# Altium schematic sheet PANEL_CH.SchDoc
size A4; SheetNumber: 9; SheetTotal: 9
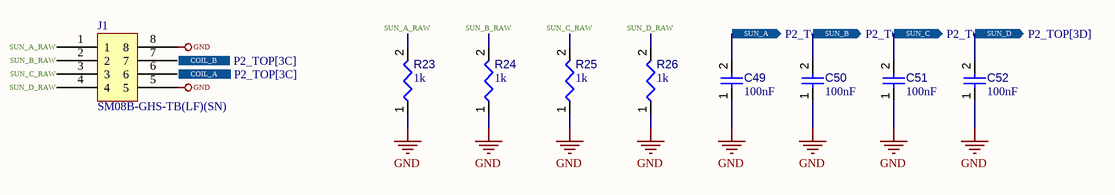
[diagram p0: PANEL_CH.SchDoc]

## Parts
C49  value 100nF  [CAPC0402(1005)60_L]  (hidden comment: Capacitor 100nF +/-20% 25V 0402)
C50  value 100nF  [CAPC0402(1005)60_L]  (hidden comment: Capacitor 100nF +/-20% 25V 0402)
C51  value 100nF  [CAPC0402(1005)60_L]  (hidden comment: Capacitor 100nF +/-20% 25V 0402)
C52  value 100nF  [CAPC0402(1005)60_L]  (hidden comment: Capacitor 100nF +/-20% 25V 0402)
J1  SM08B-GHS-TB(LF)(SN)
R23  value 1k  [RESC0402(1005)_L]  (hidden comment: Resistor 1K +/-5 % 0402 63 mW)
R24  value 1k  [RESC0402(1005)_L]  (hidden comment: Resistor 1K +/-5 % 0402 63 mW)
R25  value 1k  [RESC0402(1005)_L]  (hidden comment: Resistor 1K +/-5 % 0402 63 mW)
R26  value 1k  [RESC0402(1005)_L]  (hidden comment: Resistor 1K +/-5 % 0402 63 mW)

## Ports
COIL_A (out, see P2_TOP[3C]), COIL_B (out, see P2_TOP[3C]), SUN_A (out, see P2_TOP[3C]), SUN_B (out, see P2_TOP[3D]), SUN_C (out, see P2_TOP[3D]), SUN_D (out, see P2_TOP[3D])

## Nets
GND: C49.1 C50.1 C51.1 C52.1 J1.5 J1.8 R23.1 R24.1 R25.1 R26.1
COIL_A: J1.6 ; port COIL_A
COIL_B: J1.7 ; port COIL_B
SUN_A: C49.2 ; port SUN_A
SUN_A_RAW: J1.1 R23.2
SUN_B: C50.2 ; port SUN_B
SUN_B_RAW: J1.2 R24.2
SUN_C: C51.2 ; port SUN_C
SUN_C_RAW: J1.3 R25.2
SUN_D: C52.2 ; port SUN_D
SUN_D_RAW: J1.4 R26.2

## Library data of the parts
C49-C52 = CMP-001-00065-4: Chip Capacitor, 100nF +/-20%, 25V, 0402, Thickness 0.6 mm; Tolerance: 10%; Max Operating Temperature: 85°C; Min Operating Temperature: -55°C; Pins: 2; Voltage Rating: 25V; Mounting Technology: SMT; Case/Package: 0402
J1 = CMP-002-00081-2: Connector Header Surface Mount, Right Angle 8 position 0.049" (1.25mm); Voltage Rating: 50V; Contact Resistance: 50mΩ; Gender: Male; Number of Contacts: 8; Current Rating: 1A; Pitch: 1.2446mm; Insulation Resistance: 100MΩ; Connector Type: Male Pin, Outer Shroud Contact; Dielectric Material: Polyamide; Orientation: Right Angle; Max Operating Temperature: 85°C; Contact Material: Copper, Tin; Contact Plating: Tin; Pins: 8; Lifecycle Status: Production; Min Operating Temperature: -25°C; Number of Rows: 1; Housing Color: Natural; REACH SVHC: Unaffected; Termination: Solder; Manufacturer Package Identifier: SM08B-GHS-TB(LF)(SN); Height: 4.35mm; Housing Material: Nylon; Fastening Type: Latch, Ramp; Number of Positions: 8; RoHS: Compliant; Lead Free: Lead Free; Terminal Pitch: 1.25mm; Color: Natural; Mounting Technology: Surface Mount
R23-R26 = CMP-009-00157-3: Chip Resistor, 1 kOhms, +/-5 %, 63 mW, -55 to 155 degC, 0402; Tolerance: 5%; Power: 63mW; Case/Package: 0402; Pins: 2; Min Operating Temperature: -55°C; Max Operating Temperature: 155°C